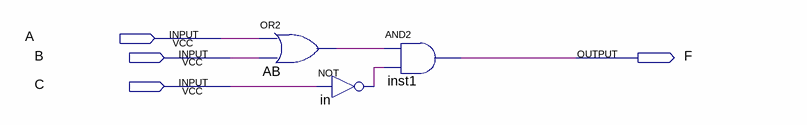
[diagram p0: schematic sheet]
// Quartus schematic lab2step1.bdf as structural Verilog: 3 symbols, 4 pins
module lab2step1 (
  input  A,
  input  B,
  input  C,
  output F
);

  wire AB_out, in_out;

  or AB (AB_out, A, B);
  not in (in_out, C);
  and inst1 (F, AB_out, in_out);
endmodule
